# Altium project AM1d-240505DZ.PrjPcb
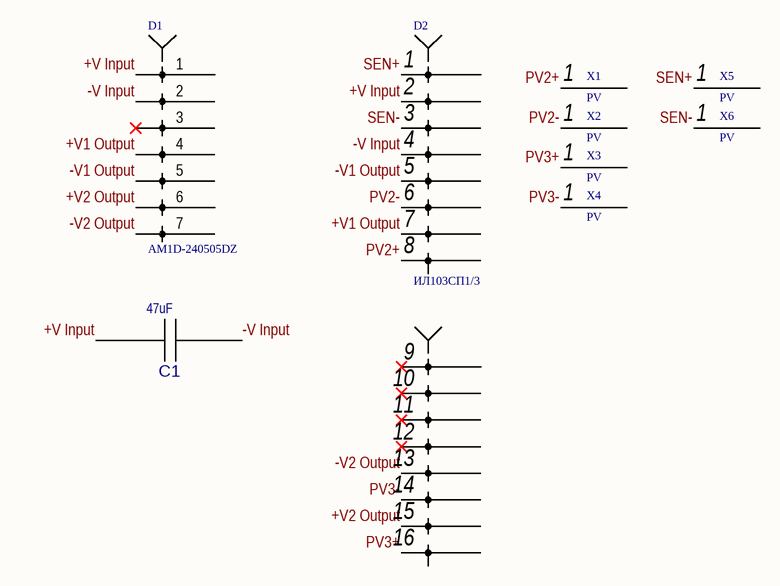
[diagram p0: AM1D-240505DZ.SchDoc]
1 sheet, 9 parts. Net scope: global (net labels, ports and power ports of the same name join across sheets).
Board file: AM1D-240505DZ.PcbDoc

## Sheet AM1D-240505DZ.SchDoc
size 410 x 297 mm; SheetNumber: 1; SheetTotal: 1

### Parts
C1  value 47uF  [0805]  (hidden comment: C0805)
D1  AM1D-240505DZ  [AM1D-Z]
D2  ИЛ103СП1/3  [ИЛ103СП1/1]
X1  PV  [PV]
X2  PV  [PV]
X3  PV  [PV]
X4  PV  [PV]
X5  PV  [PV]
X6  PV  [PV]

### Nets
+V1 Output: D1.4 D2.7
+V2 Output: D1.6 D2.15
+V Input: C1.1 D1.1 D2.2
-V1 Output: D1.5 D2.5
-V2 Output: D1.7 D2.13
-V Input: C1.2 D1.2 D2.4
PV2+: D2.8 X1.1
PV2-: D2.6 X2.1
PV3+: D2.16 X3.1
PV3-: D2.14 X4.1
SEN+: D2.1 X5.1
SEN-: D2.3 X6.1

Not connected (* = marked no-connect by the designer): D1 3*; D2 9* 10* 11* 12*

### Notes on the sheet
- Перв. примен.
- Справ. №
- Подп. и дата
- Инв. № дубл.
- Взам. инв. №
- Разраб.
- Изм.
- Лист
- № докум.
- Подп.
- Дата
- Литера
- Масса
- Масштаб
- Пров.
- Т.контр.
- Листов
- Инв. № подл.
- Н.контр.
- Утв.
- Форма 1 ГОСТ 2.104-2006
- Копировал
- Формат А3

### Library data of the parts
C1 = C0805: ComponentHeigt: 1.3; Firme: AVX; Leadform: SMD; KIND: Конденсатор; ClassName: *; Component Link: *; ComponentWeigt: *; Packaging: 0805; NN: *
D1 = AM1D-Z